# Altium schematic sheet A2x3.SchDoc: названи платы
size 1261 x 594 mm; ApprovedBy: Рогов; CheckedBy: Фамилия проверяющего; DrawnBy: Фамилия разработчика; DocumentNumber: Введите номер платы + Э3; SheetNumber: пусто если листов 1, иначе 1; SheetTotal: количество листов; Format: A2x3; DocumentType: тип схемы; Title1str: вторая строка при необходимости; ImagePath: Введите номер платы
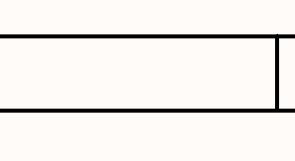
[diagram p0: A2x3.SchDoc, top column 1 of 4]
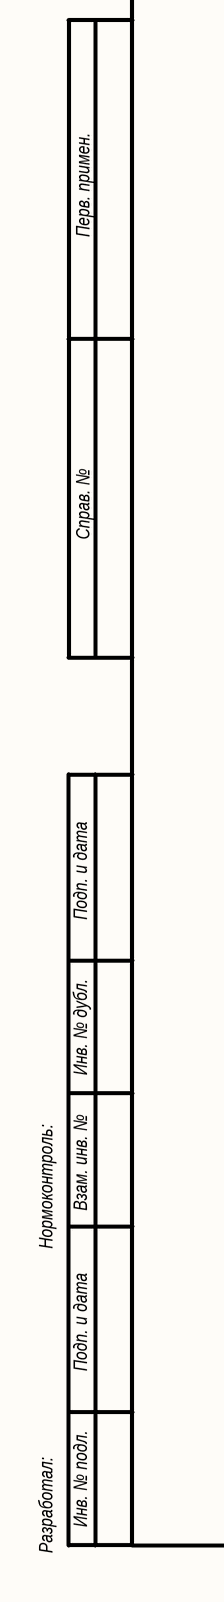
[diagram p1: A2x3.SchDoc, bottom column 1 of 4]
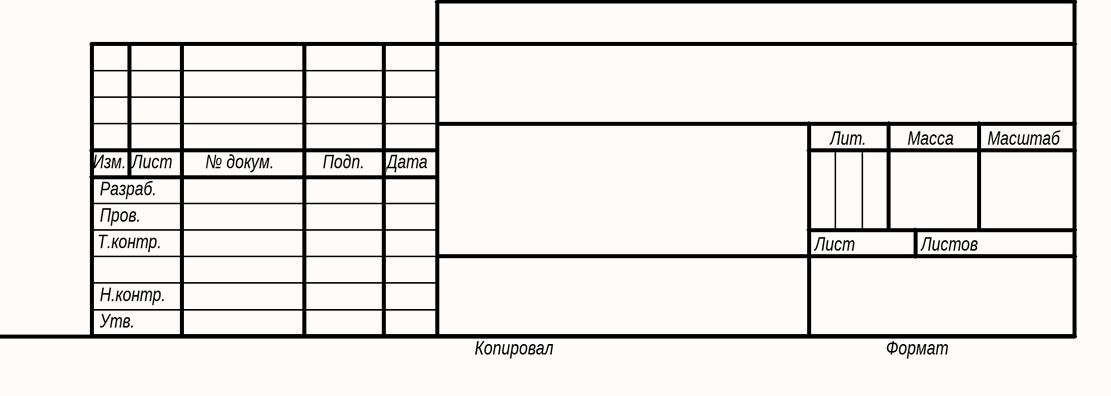
[diagram p2: A2x3.SchDoc, bottom column 4 of 4]

## Notes on the sheet
- Перв. примен.
- Справ. №
- Подп. и дата
- Инв. № дубл.
- Нормоконтроль:
- Взам. инв. №
- Изм.
- Лист
- № докум.
- Подп.
- Дата
- Лит.
- Масса
- Масштаб
- Т.контр.
- Пров.
- Разраб.
- Листов
- Разработал:
- Инв. № подл.
- Н.контр.
- Утв.
- Копировал
- Формат